# EasyEDA Pro project LinTOS_2026-10-19.epro, board PCB1
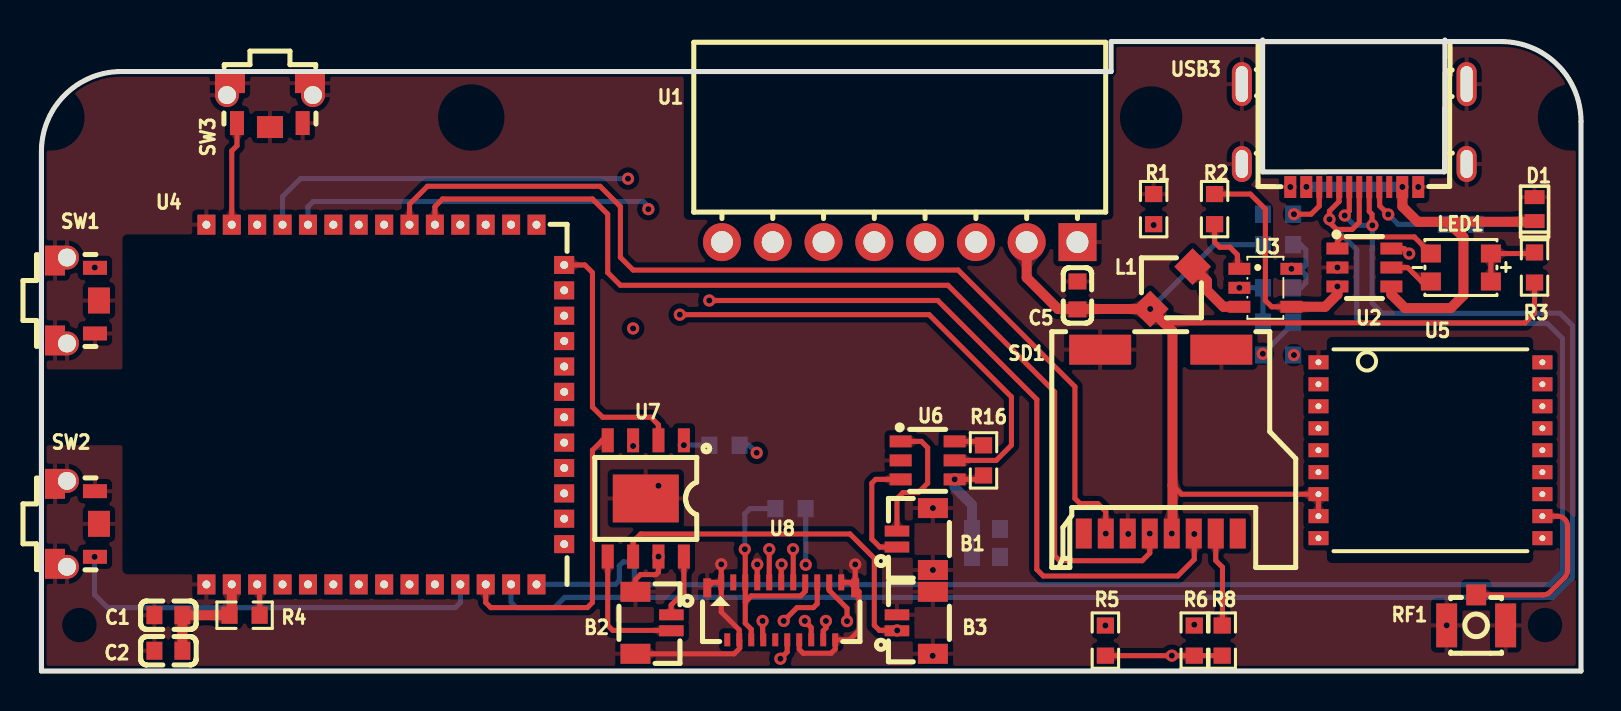
[diagram p2: board, top side]
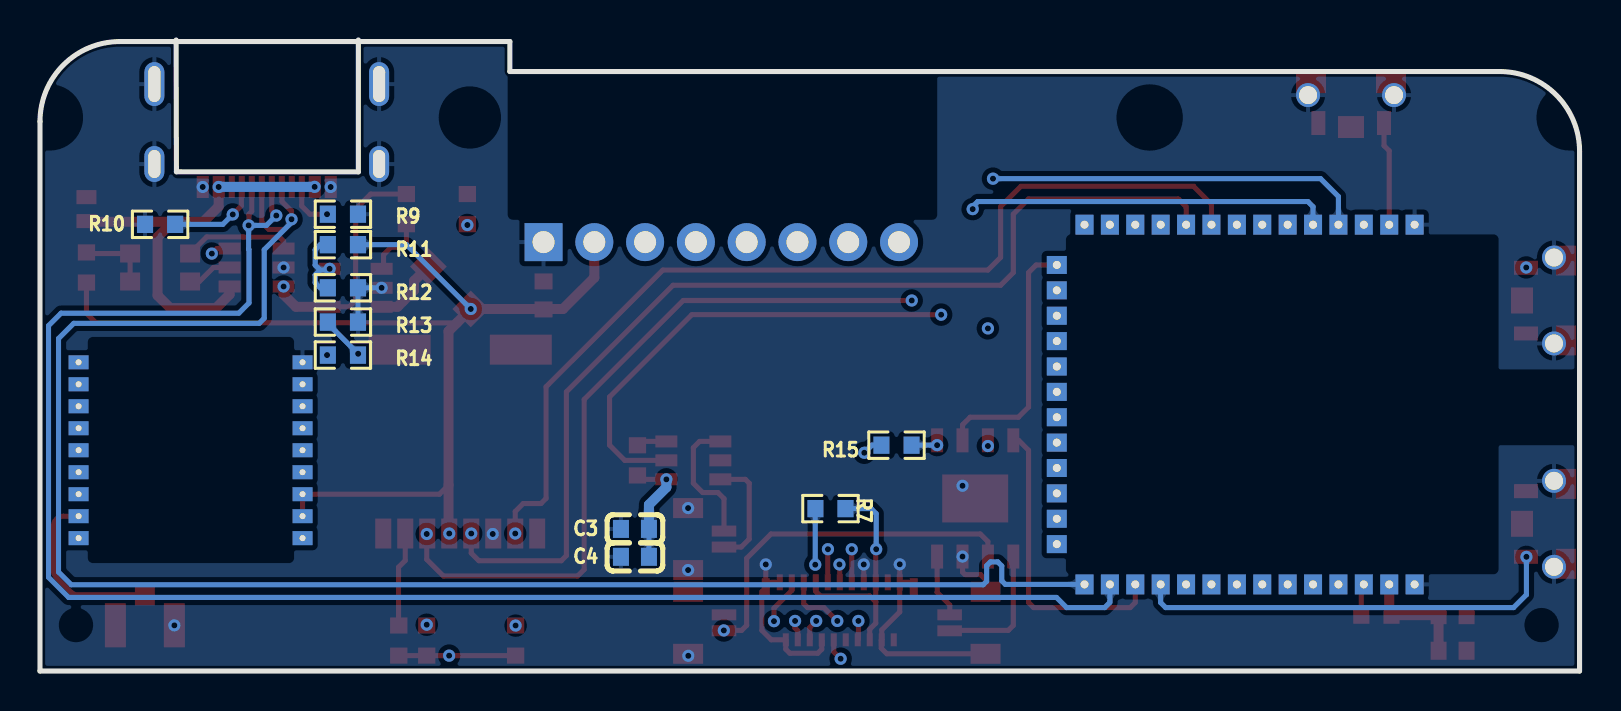
[diagram p3: board, bottom side, seen from below]

Outline 77 x 31.58 mm; copper layers: Top Layer, Inner1, Inner2, Bottom Layer. Coordinates in mm from the lower left corner of the outline.
Outline path: 0,26 arc(1.17,28.83) 4,30 53.5,30 53.5,31.5 73,31.5 arc(75.83,30.33) 77,27.5 77,0 0,0 0,26
Stack: Top Layer 0.035mm Outer layer thickness 1oz / Dielectric1 0.2104mm 7628 RC49% 8.6mil / Inner1 0.0152mm Inner layer thickness / Dielectric2 1.065mm 1.1mm H/HOZ Copper / Inner2 0.0152mm Inner layer thickness / Dielectric3 0.2104mm 7628 RC49% 8.6mil / Bottom Layer 0.035mm Outer layer thickness 1oz

## Design rules (mm)
net GPIO19: DP1
net GPIO20: DP1
spacing copperThickness1oz (default): track to track 0.102, other pairs 0.152 to 0.3
spacing copperThickness2oz: track to track 0.203, other pairs 0.152 to 0.3
track width copperThickness1oz (default): min 0.127, default 0.254, max 2.54
track width copperThickness2oz: min 0.203, default 0.254, max 2.54
differential pair differentialPair (default): width min 0.127, default 0.254, max 2.54; gap min 0.152, default 0.152
net GND uses copperRegion

## Placement (name value [footprint] x y rotation side)
B1  HC-0.8-2PWT  [CONN-SMD_2P-P0.80_HCTL_HC-0.8-2PWT]  43.69 6.6 90 top
B2  HC-0.8-2PWT  [CONN-SMD_2P-P0.80_HCTL_HC-0.8-2PWT]  30.61 2.41 270 top
B3  HC-0.8-2PWT  [CONN-SMD_2P-P0.80_HCTL_HC-0.8-2PWT]  43.69 2.41 90 top
C1  100nF  [C0603]  6.35 2.79 0 top
C2  10uF  [C0603]  6.35 1.02 0 top
C3  100nF  [C0603]  47.24 7.11 180 bottom
C4  4.7uF  [C0603]  47.24 5.72 0 bottom
C5  10uF  [C0603]  51.82 18.8 270 top
D1  LTVS16H5.0ET5G  [DFN1610-2L_L1.6-W1.0-P1.10-RD]  74.68 23.11 90 top
L1  2.2uH  [IND-SMD_L3.0-W3.0_CDRH2D18-HPNP]  56.51 19.18 270 top
LED1  A-SP1552GHR6C-C01-2T  [LED-SMD_4P-L3.2-W1.6-TR_A-SP1552GHR6C]  70.99 20.19 0 top
R1  3.3kΩ  [R0603]  55.63 23.11 90 top
R2  100kΩ  [R0603]  58.67 23.11 90 top
R3  470Ω  [R0603]  74.68 20.19 270 top
R4  10kΩ  [R0603]  10.16 2.79 0 top
R5  10kΩ  [R0603]  53.21 1.52 90 top
R6  10kΩ  [R0603]  57.66 1.52 90 top
R7  10kΩ  [R0603]  37.47 8.13 180 bottom
R8  10kΩ  [R0603]  59.06 1.52 90 top
R9  5.1kΩ  [R0603]  61.85 22.86 0 bottom
R10  5.1kΩ  [R0603]  70.99 22.35 180 bottom
R11  680kΩ  [R0603]  61.85 21.34 180 bottom
R12  150kΩ  [R0603]  61.85 19.18 0 bottom
R13  100kΩ  [R0603]  61.85 17.46 0 bottom
R14  200kΩ  [R0603]  61.85 15.81 180 bottom
R15  100kΩ  [R0603]  34.16 11.3 0 bottom
R16  10kΩ  [R0603]  47.12 10.54 270 top
RF1  6GHz  [IPEX-SMD_BWIPX-1-001E]  71.75 3.05 270 top
SD1  TFS10-00S1-2000-A  [SIM-SMD_TFS10-00S1-2000-A]  55.98 11.48 0 top
SW1  TS-1010A-B  [SW-SMD_TS-1010A-B]  1.78 18.54 180 top
SW2  TS-1010A-B  [SW-SMD_TS-1010A-B]  1.78 7.37 180 top
SW3  TS-1010A-B  [SW-SMD_TS-1010A-B]  11.43 28.32 90 top
U1  PM254-1-08-W-8.5  [HDR-TH_8P-P2.54-H-F-W10.0-N]  42.93 21.46 180 top
U2  TP4057  [SOT-23-6_L2.9-W1.6-P0.95-LS2.8-BR]  66.17 20.19 180 top
U3  SY8088AAC  [SOT-23-5_L3.0-W1.7-P0.95-LS2.8-BR]  61.21 19.18 180 top
U4  2.4GHz  [WIRELM-SMD_ESP32-S3-WROOM-1]  17.14 13.33 90 top
U5  MAX-M10S-00B  [SMD-18_L10.1-W9.7-P1.10-TL_SKG09F]  69.47 11.05 0 top
U6  TM6604  [SOT-23-6_L2.9-W1.6-P0.95-LS2.8-BR]  44.32 10.54 180 top
U7  NS4168  [ESOP-8_L4.9-W3.9-P1.27-LS6.0-BL-EP]  30.23 8.64 180 top
U8  FH35C-21S-0.3SHW(50)  [FPC-SMD_21P-P0.30_FH35C-21S-0.3SHW-50]  37 3 180 top
USB3  TYPEC-302-BRP16SC16  [USB-C-SMD_TYPEC-302-BRP16SC16]  65.66 26.8 180 top

## Footprints (pads in the part's own frame, mm; a bottom-side part is the same pattern mirrored in y, then rotated)
C0603
  rect 0.8x0.9 smd: 1(-0.7,0) 2(0.7,0)
CONN-SMD_2P-P0.80_HCTL_HC-0.8-2PWT
  rect 0.55x1.23 smd: 1(-0.4,0.898) 2(0.4,0.898)
  rect 1x1.5 smd: 3(1.55,-0.898) 4(-1.55,-0.898)
DFN1610-2L_L1.6-W1.0-P1.10-RD
  rect 0.7x1 smd: 1(-0.6,0) 2(0.6,0)
ESOP-8_L4.9-W3.9-P1.27-LS6.0-BL-EP
  rect 0.6x1.2 smd: 1(-1.905,-2.909) 2(-0.635,-2.909) 3(0.635,-2.909) 4(1.905,-2.909) 5(1.905,2.909) 6(0.635,2.909) 7(-0.635,2.909) 8(-1.905,2.909)
  rect 3.3x2.4 smd: 9(0,0)
FPC-SMD_21P-P0.30_FH35C-21S-0.3SHW-50
  rect 0.3x0.8 smd: 1(3,-1.438) 3(2.4,-1.438) 5(1.8,-1.438) 7(1.2,-1.438) 9(0.6,-1.438) 11(0,-1.438) 13(-0.6,-1.438) 15(-1.2,-1.438) 17(-1.8,-1.438) 19(-2.4,-1.438) 21(-3,-1.438)
  rect 0.3x0.65 smd: 2(2.7,1.438) 4(2.1,1.438) 6(1.5,1.438) 8(0.9,1.438) 10(0.3,1.438) 12(-0.3,1.438) 14(-0.9,1.438) 16(-1.5,1.438) 18(-2.1,1.438) 20(-2.7,1.438)
  rect 0.4x0.95 smd: 22(-3.7,-1.163) 23(3.7,-1.163)
HDR-TH_8P-P2.54-H-F-W10.0-N
  rect 1.9x1.9 hole 1.1: 1(-8.89,0)
  round 1.9 hole 1.1: 2(-6.35,0) 3(-3.81,0) 4(-1.27,0) 5(1.27,0) 6(3.81,0) 7(6.35,0) 8(8.89,0)
IND-SMD_L3.0-W3.0_CDRH2D18-HPNP
  rect 1.3x1.3 smd rot 45: 1(-1.06,1.06) 2(1.06,-1.06)
IPEX-SMD_BWIPX-1-001E
  rect 1.05x1 smd: 1(-0.762,0)
  rect 2.2x1.05 smd: 2(0.762,-1.475) 3(0.762,1.475)
LED-SMD_4P-L3.2-W1.6-TR_A-SP1552GHR6C
  rect 1x0.9 smd: 1(1.5,0.7) 2(1.5,-0.7) 3(-1.5,-0.7) 4(-1.5,0.7)
R0603
  rect 0.806x0.864 smd: 1(-0.753,0) 2(0.753,0)
SIM-SMD_TFS10-00S1-2000-A
  rect 0.8x1.5 smd: 1(3.85,-4.6) 2(2.75,-4.6) 3(1.65,-4.6) 4(0.55,-4.6) 5(-0.55,-4.6) 6(-1.65,-4.6) 7(-2.75,-4.6) 8(-3.85,-4.6)
  rect 3.1x1.5 smd: 9(-3.03,4.6) 10(3.03,4.6)
SMD-18_L10.1-W9.7-P1.10-TL_SKG09F
  rect 1x0.7 hole 0.3: 1(-5.6,4.4) 2(-5.6,3.3) 3(-5.6,2.2) 4(-5.6,1.1) 5(-5.6,0) 6(-5.6,-1.1) 7(-5.6,-2.2) 8(-5.6,-3.3) 9(-5.6,-4.4) 10(5.6,-4.4) 11(5.6,-3.3) 12(5.6,-2.2) 13(5.6,-1.1) 14(5.6,0) 15(5.6,1.1) 16(5.6,2.2) 17(5.6,3.3) 18(5.6,4.4)
SOT-23-5_L3.0-W1.7-P0.95-LS2.8-BR
  rect 1.1x0.6 smd: 1(1.3,-0.95) 2(1.3,0) 3(1.3,0.95) 4(-1.3,0.95) 5(-1.3,-0.95)
SOT-23-6_L2.9-W1.6-P0.95-LS2.8-BR
  rect 1.1x0.6 smd: 1(1.35,-0.95) 2(1.35,0) 3(1.35,0.95) 4(-1.35,0.95) 5(-1.35,0) 6(-1.35,-0.95)
SW-SMD_TS-1010A-B
  rect 1.2x0.7 smd: 1(-0.9,1.65) 2(-0.9,-1.635)
  rect 1.1x1.3 smd: 3(-1.1,0)
  round 1.2 hole 0.9: 4(0.5,2.15) 5(0.5,-2.15)
  rect 1x1.5 smd: 4(1.1,2) 5(1.1,-2)
USB-C-SMD_TYPEC-302-BRP16SC16
  rect 0.6x1.1 smd: 1(-3.2,2.575) 2(-2.4,2.575) 11(2.4,2.575) 12(3.2,2.575)
  rect 0.3x1.1 smd: 3(-1.75,2.575) 4(-1.25,2.575) 5(-0.75,2.575) 6(-0.25,2.575) 7(0.25,2.575) 8(0.75,2.575) 9(1.25,2.575) 10(1.75,2.575)
  oval 1x1.8 hole 0.61x1.4: 13(-5.62,1.425) 14(5.62,1.425)
  oval 1x2.2 hole 0.61x1.8: 15(-5.62,-2.575) 16(5.62,-2.575)
WIRELM-SMD_ESP32-S3-WROOM-1
  rect 1x0.9 hole 0.4: 1(-9,8.895) 2(-9,7.625) 3(-9,6.355) 4(-9,5.085) 5(-9,3.815) 6(-9,2.545) 7(-9,1.275) 8(-9,0.005) 9(-9,-1.265) 10(-9,-2.535) 11(-9,-3.805) 12(-9,-5.075) 13(-9,-6.345) 14(-9,-7.615) 27(9,-7.615) 28(9,-6.345) 29(9,-5.075) 30(9,-3.805) 31(9,-2.535) 32(9,-1.265) 33(9,0.005) 34(9,1.275) 35(9,2.545) 36(9,3.815) 37(9,5.085) 38(9,6.355) 39(9,7.625) 40(9,8.895)
  rect 0.9x1 hole 0.4: 15(-6.985,-9) 16(-5.715,-9) 17(-4.445,-9) 18(-3.175,-9) 19(-1.905,-9) 20(-0.635,-9) 21(0.635,-9) 22(1.905,-9) 23(3.175,-9) 24(4.445,-9) 25(5.715,-9) 26(6.985,-9)

## Nets
As in the schematic, except:
GND: B1.3 B1.4 B2.3 B2.4 B3.2 B3.3 B3.4 C1.1 C2.1 C3.1 C4.2 C5.1 D1.2 R1.2 R9.1 R10.1 R12.1 R13.1 RF1.2 RF1.3 SD1.6 SD1.9 SD1.10 SW1.1 SW1.3 SW1.4 SW1.5 SW2.2 SW2.3 SW2.4 SW2.5 SW3.2 SW3.3 SW3.4 SW3.5 U1.1 U2.2 U3.2 U4.1 U4.40 U5.1 U6.2 U7.7 U7.9 U8.1 U8.4 U8.7 U8.14 U8.20 U8.21 U8.22 U8.23 USB3.1 USB3.12 USB3.13 USB3.14 USB3.15 USB3.16

Pads without a net: SD1 1 8; U4 28 29 30; U5 4 6 9 10 12 13 14 15 16 17 18; U8 2 3 10; USB3 3 9

## Via types
v1: diameter 0.61, hole 0.305, Top Layer to Bottom Layer, 58 vias

## Routing (per net, layer and track width the routed paths; a pad name or vN(x,y) marks a point on that pad's centre or on a via; arc(x,y) is an arc through that point)
+5V: length 21.2
  Top Layer w0.5: D1.1 74.64,22.48 70.36,22.48 ; 70.36,22.48 71.12,21.72 71.12,18.8 70.49,18.16 68.2,18.16 67.52,18.84 U2.4 ; 70.36,22.48 68.83,22.48 68.07,23.25 v1(68.07,24.22)
  Bottom Layer w0.5: 63.3,24.23 68.06,24.23 v1(68.07,24.22)
  vias: v1(63.26,24.23)
GND: length 25.8
  Top Layer w0.254: U8.1 33.58,4.44 U8.23 ; U8.1 34,2.96 34.9,2.06 U8.4 34.93,1.54 34.93,1.14 34.65,0.86 B2.3 ; U8.1 v1(34,5.34) ; 29.71,3.84 29.71,4.58 29.96,4.83 30.73,4.83 30.86,4.95 v1(30.86,5.73) ; U8.7 v1(35.8,5.33) ; U8.22 v1(40.7,5.33) ; U8.22 40.89,3.97 40.89,2.03 40.42,1.56 U8.20 39.7,1.09 39.5,0.89 38.1,0.89 37.9,1.09 U8.14 ; U8.22 40.43,4.44 U8.21
  Bottom Layer w0.254: v1(59.91,19.18) R12.1 R13.1
  vias: v1(30.86,9.27) v1(44.59,8.15) v1(44.59,5.05) v1(44.58,0.76) v1(54.36,6.86) v1(62.46,24.22) v1(64.82,20.19) v1(68.86,24.22) v1(70.28,2.29)
VBAT: length 72
  Top Layer w0.254: U7.6 29.59,6.48 29.97,6.86 40.44,6.86 41.66,5.64 41.66,2.29 41.91,2.03 v1(42.8,2.03) ; v1(45.67,9.59) 46.92,9.59 R16.2 ; U3.4 61.53,18.23 61.21,18.54 61.21,23.11 60.46,23.87 R2.2
  Top Layer w0.5: U3.4 64.2,18.23 64.82,18.84 v1(64.82,19.24)
  Inner2 w0.5: v1(64.82,19.24) 64.82,18.84 64.26,18.29 62.93,18.29 62.61,17.97 62.61,14.86 62.1,14.35 51.69,14.35 50.55,13.21 50.55,11.43 48.71,9.59 v1(45.67,9.59) 43.37,9.59 42.8,9.02 v1(42.8,2.03)
  Bottom Layer w0.254: C4.1 C3.2
  Bottom Layer w0.5: v1(45.67,9.59) 45.67,9.19 46.54,8.32 C3.2
  vias: v1(62.64,15.81)
VCC3V3: length 154.4
  Top Layer w0.254: R8.1 57.53,0.77 ; 57.53,0.77 57.55,0.76 ; 57.53,0.77 v1(56.54,0.77) 53.09,0.77 ; 35.2,3.45 35.51,3.76 37.97,3.76 38.2,3.99 38.2,4.44 ; 35.2,3.45 35.2,4.44 ; 35.2,3.45 35.2,2.39 35.5,2.09 U8.6 ; 56.15,17.42 74.2,17.42 74.68,17.9 R3.2 ; 56.57,9.3 57.02,8.85 U5.7 63.87,7.75 ; v1(35.18,6.1) 35.2,6.07 U8.5
  Top Layer w0.5: C2.2 C1.2 R4.1 ; 9.52,2.65 U4.2 ; U1.2 49.28,19.69 50.84,18.12 v1(55.46,18.12) 56.15,17.42 56.57,17 56.57,6.92 v1(56.53,6.88)
  Inner1 w0.254: v1(56.53,6.88) 56.53,0.78 v1(56.54,0.77)
  Inner2 w0.254: 35.81,10.8 35.18,10.16 v1(35.18,6.1)
  Inner2 w0.5: v1(55.46,18.12) 50.12,18.12 49.28,17.27 49.28,12.32 47.88,10.92 v1(35.77,10.92) 33.77,10.92 32.64,9.79 32.64,3.56 29.97,0.89 10.29,0.89 9.52,1.66 U4.2
  Bottom Layer w0.254: R11.2 58.67,21.34 v1(55.46,18.12) ; R7.2 35.43,8.13 35.18,7.87 v1(35.18,6.1) ; R15.2 35.39,11.3 v1(35.77,10.92)
GPIO0: length 26.3
  Top Layer w0.254: 2.92,20.19 v1(2.67,20.19)
  Inner2 w0.254: v1(2.67,20.19) 2.67,22.73 3.43,23.5 24.51,23.5 24.76,23.24 24.76,22.31 24.76,22.3
GPIO1: length 5
  Top Layer w0.254: 9.52,22.3 9.52,26.03 9.78,26.29 ; 9.78,26.29 9.78,27.17
GPIO2: length 50.9
  Top Layer w0.254: U8.16 38.5,2.18 38.2,2.47
  Inner1 w0.254: 38.2,2.47 38.2,2.9 38.86,3.56 38.86,12.45 37.34,13.97 29.72,13.97 28.7,14.99 28.7,23.11 27.56,24.26 11.3,24.26 10.79,23.74 10.79,22.08
  vias: v1(38.18,2.51)
GPIO3: length 29.4
  Inner2 w0.254: U1.5 41.66,14.22 41.4,13.97 29.34,13.97 28.32,12.95 28.32,7.37 27.31,6.35 26.04,6.35
GPIO4: length 70.3
  Inner2 w0.254: 12.06,4.58 12.06,2.42 12.57,1.91 29.59,1.91 31.5,3.81 31.5,11.75 31.89,12.14 47.19,12.14 48.01,12.95 48.01,17.91 49.15,19.05 56.51,19.05 57.53,18.03 60.07,18.03 61.09,17.02 v1(61.09,15.88)
  Bottom Layer w0.254: v1(61.09,15.88) 62.6,17.39 R13.2
GPIO5: length 27.3
  Top Layer w0.254: U8.12 37.3,0.96 v1(36.96,0.62)
  Inner1 w0.254: v1(36.96,0.62) 15.64,0.62 13.33,2.93 13.33,4.58
GPIO6: length 51
  Inner2 w0.254: 14.6,4.58 14.6,3.18 15.24,2.54 28.45,2.54 30.23,4.32 30.23,12.19 30.73,12.7 46.1,12.7 46.74,13.33 U1.3
GPIO7: length 30.1
  Top Layer w0.254: v1(40.29,2.5) 40.29,3.14 39.4,4.03 U8.19
  Inner1 w0.254: 15.87,4.58 15.87,2.55 17.14,1.27 39.62,1.27 40.29,1.94 v1(40.29,2.5)
GPIO8: length 15.3
  Top Layer w0.254: U7.4 28.05,11.54 27.56,11.05 27.56,3.43 27.31,3.17 22.47,3.17 22.22,3.43 22.22,4.58
GPIO9: length 5.1
  Inner1 w0.254: v1(29.59,11.26) 29.59,9.65 28.83,8.89 26.42,8.89
GPIO10: length 23.3
  Inner2 w0.254: U1.6 39.12,14.86 38.86,14.61 28.83,14.61 27.56,13.33 27.56,10.41 27.31,10.16 26.04,10.16
GPIO11: length 17.9
  Top Layer w0.254: U8.9 v1(36.4,6.09)
  Inner1 w0.254: 26.04,11.43 27.05,11.43 27.76,12.14 35.61,12.14 36.4,11.35 v1(36.4,6.09)
GPIO12: length 18.7
  Top Layer w0.254: v1(37.02,5.33) 37,5.32 U8.11
  Inner1 w0.254: v1(37.02,5.33) 37.01,5.34 37.01,11.76 36.07,12.7 26.04,12.7
GPIO13: length 17.1
  Inner2 w0.254: 26.04,13.97 27.05,13.97 28.32,15.24 36.19,15.24 36.58,15.62 U1.7
GPIO14: length 13.5
  Inner2 w0.254: U1.8 34.04,16.38 33.53,15.88 28.19,15.88 27.56,15.24 26.04,15.24
GPIO15: length 25.6
  Top Layer w0.254: v1(39.24,2.51) 39.24,2.5 39.24,2.16 39.1,2.02 U8.18
  Inner1 w0.254: 17.14,4.58 17.14,2.55 17.76,1.92 38.65,1.92 v1(39.24,2.51)
GPIO16: length 43.6
  Inner2 w0.254: 18.41,4.58 18.41,3.43 18.66,3.17 27.31,3.17 28.96,4.83 28.96,12.32 29.97,13.33 43.94,13.33 44.2,13.59 U1.4
GPIO17: length 22.8
  Top Layer w0.254: 37.14,2.47 37.08,2.47 ; U8.17 38.8,3.37 38.61,3.17 37.79,3.17 v1(37.12,2.51)
  Inner1 w0.254: v1(37.12,2.51) 36.46,3.17 35.69,3.17 35.05,2.54 20.32,2.54 19.68,3.18 19.68,4.58
GPIO18: length 22
  Top Layer w0.254: v1(2.66,5.72) 2.93,5.72
  Bottom Layer w0.254: v1(2.66,5.72) 2.66,3.82 3.3,3.17 20.7,3.17 20.96,3.43 20.96,4.58 20.95,4.58
GPIO19: length 87
  Top Layer w0.254: v1(66.57,22.3) 66.55,22.32 66.55,22.86 66.41,23 USB3.5 ; USB3.7 65.41,23.02 v1(65.18,22.79)
  Bottom Layer w0.254: v1(65.18,22.79) 65.67,22.3 v1(66.57,22.3) 66.57,21.1 66.55,21.08 66.55,18.42 67.06,17.91 75.95,17.91 76.57,17.28 76.57,4.69 75.56,3.68 26.16,3.68 25.65,3.17 23.75,3.17 23.49,3.43 23.49,4.58
GPIO20: length 86.8
  Top Layer w0.254: USB3.8 64.9,24.21 64.9,23.5 64.42,23.02 v1(64.42,22.61) 64.42,22.45 64.77,22.1 65.55,22.1 65.91,22.45 USB3.6
  Bottom Layer w0.254: U4.14 28.72,4.33 28.9,4.51 28.9,5.26 29.1,5.46 29.46,5.46 29.65,5.27 29.65,4.49 29.83,4.32 75.44,4.32 76.07,4.95 76.07,16.64 75.31,17.4 66.04,17.4 65.79,17.65 65.79,21.08 64.42,22.45 v1(64.42,22.61)
GPIO21: length 50.1
  Top Layer w0.254: v1(57.66,6.86) 57.66,5.59 56.83,4.76 50.11,4.76 49.78,5.08 49.78,13.59 44.83,18.54 v1(33.4,18.54)
  Inner1 w0.254: v1(57.66,6.86) v1(57.66,2.32)
  Inner2 w0.254: 26.04,16.51 32.64,16.51 33.4,17.27 v1(33.4,18.54)
GPIO38: length 52.2
  Top Layer w0.254: 19.68,22.08 19.68,23.24 20.07,23.62 27.56,23.62 28.32,22.86 28.32,19.94 28.96,19.3 45.34,19.3 50.67,13.97 50.67,5.77 50.93,5.52 55.05,5.52 55.43,5.9 v1(55.43,6.88)
GPIO39: length 53.7
  Top Layer w0.254: 18.41,22.08 18.41,23.36 19.3,24.26 27.94,24.26 28.96,23.24 28.96,20.7 29.59,20.07 45.85,20.07 51.69,14.22 51.69,8.64 51.94,8.38 52.83,8.38 53.23,7.98 v1(53.23,6.88)
  Inner1 w0.254: v1(53.23,6.88) 53.23,4.93 53.21,4.92 v1(53.21,2.28)
GPIO40: length 38.9
  Top Layer w0.254: v1(37.59,6.1) 37.6,6.09 U8.13
  Inner1 w0.254: 17.14,22.3 17.14,22.31 17.14,23.11 17.53,23.5 27.18,23.5 27.94,22.73 27.94,14.22 28.83,13.33 36.58,13.33 37.59,12.32 v1(37.59,6.1)
GPIO45: length 12.9
  Top Layer w0.254: 26.01,20.32 27.18,20.32 27.56,19.94 27.56,13.21 28.07,12.7 30.48,12.7 30.86,12.32 U7.2
GPIO46: length 10.1
  Inner1 w0.254: v1(32.13,11.3) 32.13,8.76 30.99,7.62 26.42,7.62
  Bottom Layer w0.254: 33.54,11.3 v1(32.13,11.3)
GPIO47: length 42.1
  Inner1 w0.254: 63.97,11.05 63.5,11.05 62.74,11.81 62.74,12.45 62.48,12.7 40.39,12.7 38.35,14.73 30.23,14.73 29.59,15.37 v1(29.59,17.14)
  Inner2 w0.254: v1(29.59,17.14) 27.81,17.14 27.18,17.78 26.04,17.78
GPIO48: length 30.3
  Top Layer w0.254: U6.5 47.75,10.54 48.51,11.3 48.51,13.72 44.4,17.83 v1(31.93,17.83)
  Inner2 w0.254: v1(31.93,17.83) 31.85,17.91 28.45,17.91 27.31,19.05 26.04,19.05
LCD_RESET: length 8.4
  Top Layer w0.254: v1(36.07,2.51) 36.07,1.59 U8.8
  Inner2 w0.254: v1(36.07,2.51) 36.07,3.56 36.32,3.81 37.97,3.81 38.23,4.06 v1(38.23,5.32)
  Bottom Layer w0.254: R7.1 38.23,8.12 v1(38.23,5.32)
LED-GREEN: length 1.5
  Top Layer w0.254: 68.33,20.19 69.03,19.49 69.49,19.49
LED-Green: length 0.8
  Top Layer w0.254: U2.5 68.33,20.19
LED-RED: length 5.5
  Top Layer w0.254: 64.82,21.14 64.82,21.51 65.02,21.72 66.85,21.72 66.85,21.72 68.66,21.72 69.49,20.89
U0RXD: length 59.3
  Inner1 w0.254: 63.97,14.35 62.99,14.35 62.61,13.97 41.4,13.97 39.37,16 31.88,16 31.12,16.76 31.12,18.03 30.35,18.8 v1(30.35,23.11)
  Bottom Layer w0.254: 13.33,22.08 13.33,23.24 13.59,23.5 30.1,23.5 30.35,23.24 v1(30.35,23.11)
U0TXD: length 63.1
  Inner1 w0.254: 63.97,13.25 63.88,13.33 40.89,13.33 38.86,15.37 30.99,15.37 30.35,16 30.35,17.65 29.59,18.42 29.59,24.38 v1(29.34,24.64)
  Bottom Layer w0.254: v1(29.34,24.64) 12.95,24.64 12.06,23.74 12.06,22.08
$1N168: length 3.4
  Top Layer w0.5: U3.3 59.12,18.23 58.29,19.05 58.29,19.52 57.57,20.24
$1N178: length 3.8
  Bottom Layer w0.254: 62.99,20.07 62.48,20.07 ; 62.99,20.07 63.24,19.82 63.24,19.43 62.98,19.18 R12.2 ; 62.99,20.07 63.24,20.31 63.24,21.08 62.98,21.34 R11.1
  vias: v1(62.51,20.13)
$1N207: length 3.6
  Top Layer w0.254: LED1.2 LED1.1 74.62,20.89 R3.1
$1N209: length 14.8
  Top Layer w0.254: U2.6 68.15,21.14 v1(68.41,20.89)
  Inner1 w0.254: v1(68.41,20.89) 68.21,21.08 56.13,21.08 55.63,21.59 v1(55.63,22.32)
$1N229: length 5.7
  Top Layer w0.254: U6.3 41.72,9.59 41.53,9.4 41.53,6.6 41.93,6.2 B1.1
$1N248: length 3
  Top Layer w0.254: U3.1 59.82,20.22 59.82,20.83 59.44,21.21 58.93,21.21 58.67,21.46 R2.1
$1N390: length 4.9
  Top Layer w0.254: v1(67.36,22.85) 66.93,23.28 66.93,24.46
  Bottom Layer w0.254: v1(67.36,22.85) 67.85,22.35 R10.2
$1N401: length 8.9
  Top Layer w0.254: RF1.1 75.1,3.81 arc(75.3,3.85) 75.46,3.96 76.18,4.68 arc(76.29,4.84) 76.33,5.03 76.33,7.25 arc(76.18,7.6) 75.83,7.75 75.07,7.75 ; 74.97,7.75 74.97,7.75
$1N406: length 3.2
  Top Layer w0.254: U7.8 32.13,3.94 31.5,3.3 31.5,2.82 B2.1
$1N407: length 6.7
  Top Layer w0.254: U7.5 28.32,2.29 28.57,2.03 31.49,2.03 B2.2
$1N442: length 1.6
  Top Layer w0.254: R4.2 10.91,4.21 U4.3
$1N487: length 6.7
  Top Layer w0.254: U6.1 44.01,11.49 44.32,11.18 44.32,9.4 43.86,8.93 43.1,8.93 42.79,8.63 B1.2
$1N559: length 2.4
  Top Layer w0.254: USB3.10 63.91,23.27 63.5,22.86 v1(62.64,22.86)
$1N575: length 4.8
  Top Layer w0.254: SD1.2 58.73,5.53 59.07,5.19 59.07,2.26
$1N576: length 1.5
  Top Layer w0.254: R16.1 46.92,11.49 U6.6

## Copper pours and planes (outline as drawn; the poured copper is in the pictures)
GND on Top Layer: -1.27,34.92 80.01,34.92 80.01,-1.02 -1.27,-1.02
GND on Bottom Layer: 0,31.62 76.96,31.62 76.96,0 0,0

Small or netless copper shapes (teardrops, artwork), in the pictures only: 140 on Top Layer, 40 on Bottom Layer, 34 on Inner1, 35 on Inner2
